# Altium project 24V-70A-Power-Board-v2.0.PrjPcb (part 6 of 8)
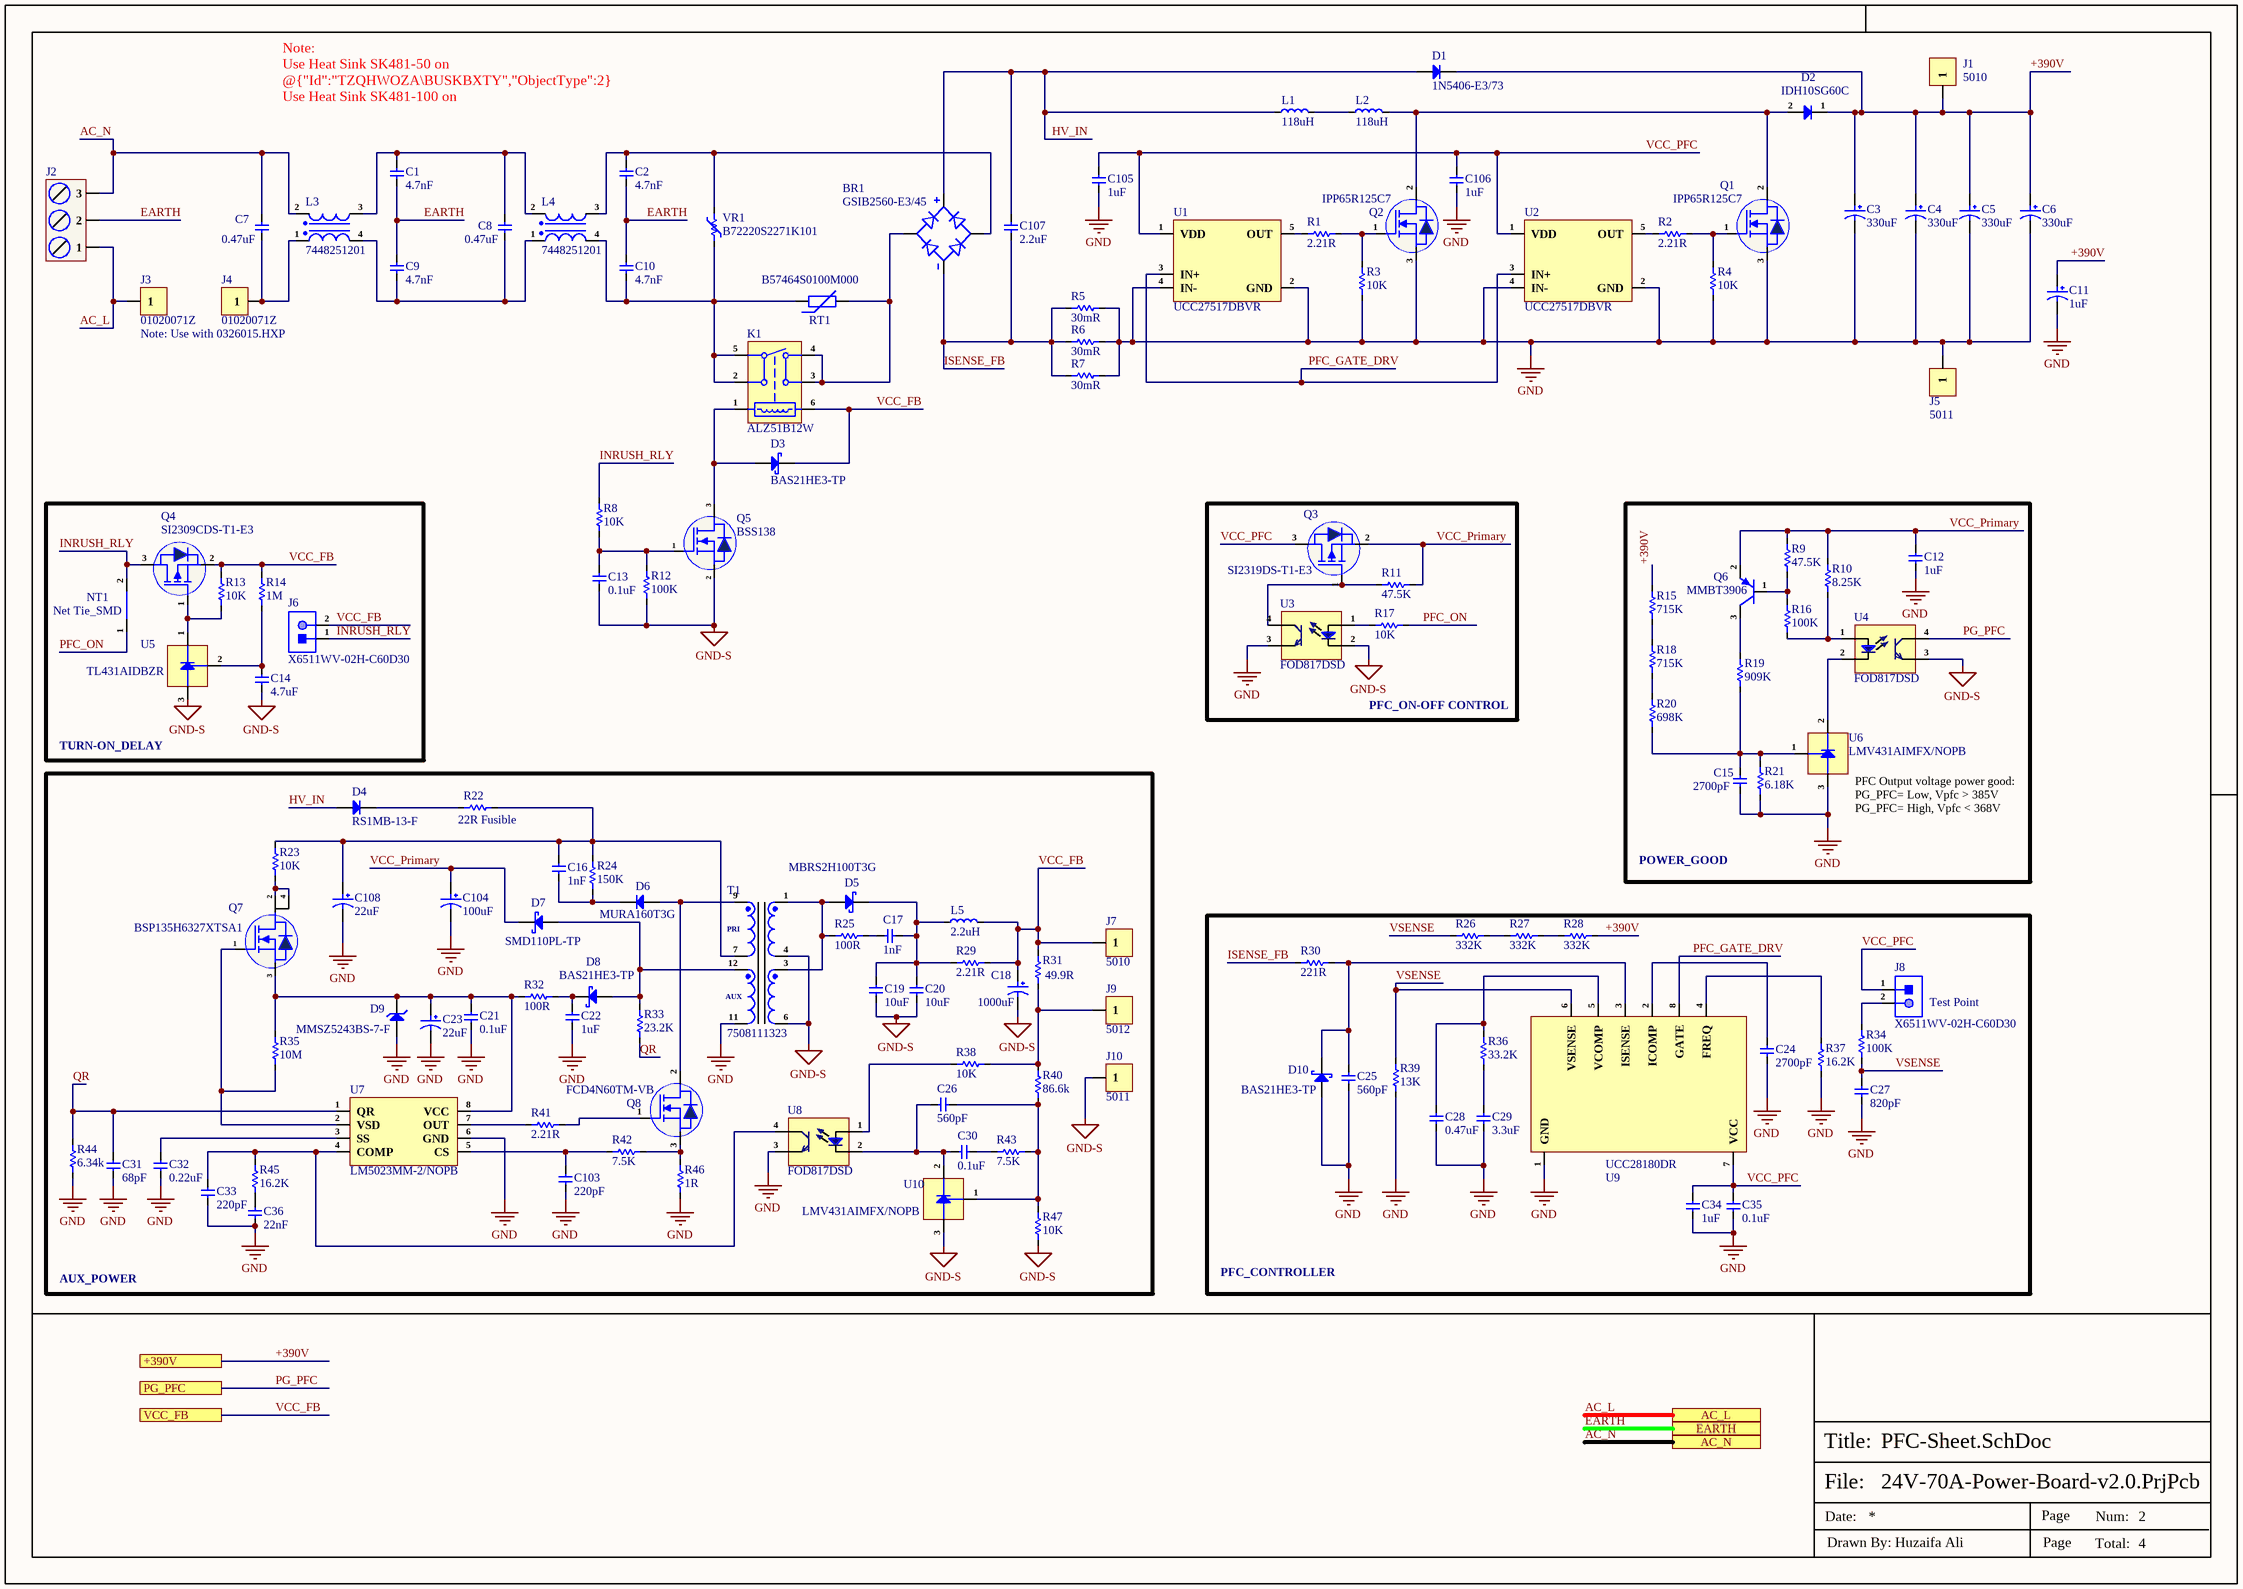
[diagram p8: PFC-Sheet.SchDoc]

## Sheet PFC-Sheet.SchDoc (continued)

### Library data of the parts (continued)
R37 R45 = CRCW060316K2FKEA: RES SMD 16.2K OHM 1% 1/10W 0603; Manufacturer: Vishay; Item Type: Resistors; Voltage Rating (DC): 75V; Supplier: Mouser; LCSC Part Number: C844531; Manufacturer Part Number: CRCW060316K2FKEA; RoHS: Yes; Stock: 14717; Pricing: 1=0.1, 10=0.016, 50=0.016, 100=0.01, 1000=0.008, 5000=0.005, 10000=0.004, 50000=0.003 (USD); Lead Free: 5697LeadFree; ComponentLink1URL: https://datasheet.ciiva.com/11810/0900766b80d98afc-11810432.pdf?src-supplier=Rs; ComponentLink1Description: https://datasheet.ciiva.com/11810/0900766b80d98afc-11810432.pdf?src-supplier=Rs; ComponentLink2URL: https://datasheet.ciiva.com/2513/dcrcwe3-2513620.pdf?src-supplier=Digikey; ComponentLink2Description: https://datasheet.ciiva.com/2513/dcrcwe3-2513620.pdf?src-supplier=Digikey; ComponentLink3URL: https://datasheet.ciiva.com/2513/dcrcwe3-2513621.pdf?src-supplier=Digikey; ComponentLink3Description: https://datasheet.ciiva.com/2513/dcrcwe3-2513621.pdf?src-supplier=Digikey; ComponentLink4URL: https://datasheet.ciiva.com/2513/dcrcwe3-2513622.pdf?src-supplier=Digikey; ComponentLink4Description: https://datasheet.ciiva.com/2513/dcrcwe3-2513622.pdf?src-supplier=Digikey; ComponentLink5URL: https://datasheet.ciiva.com/3257/dcrcwe3-3257083.pdf?src-supplier=Avnet; ComponentLink5Description: https://datasheet.ciiva.com/3257/dcrcwe3-3257083.pdf?src-supplier=Avnet; ComponentLink6URL: https://datasheet.ciiva.com/16204/dcrcwe3-16204298.pdf?src-supplier=Future+Electronics; ComponentLink6Description: https://datasheet.ciiva.com/16204/dcrcwe3-16204298.pdf?src-supplier=Future+Electronics; ComponentLink7URL: https://datasheet.ciiva.com/7663/1697337-7663893.pdf?src-supplier=Element14; ComponentLink7Description: https://datasheet.ciiva.com/7663/1697337-7663893.pdf?src-supplier=Element14; ComponentLink8URL: https://datasheet.ciiva.com/7173/1635184-7173002.pdf?src-supplier=Newark; ComponentLink8Description: https://datasheet.ciiva.com/7173/1635184-7173002.pdf?src-supplier=Newark; ComponentLink9URL: https://datasheet.ciiva.com/22702/1697337-22702885.pdf?src-supplier=Element14; ComponentLink9Description: https://datasheet.ciiva.com/22702/1697337-22702885.pdf?src-supplier=Element14; ComponentLink10URL: https://datasheet.ciiva.com/16787/70201119-16787821.pdf?src-supplier=Allied+Electronics; ComponentLink10Description: https://datasheet.ciiva.com/16787/70201119-16787821.pdf?src-supplier=Allied+Electronics; ComponentLink11URL: https://datasheet.ciiva.com/22869/70201119-22869438.pdf?src-supplier=Allied+Electronics; ComponentLink11Description: https://datasheet.ciiva.com/22869/70201119-22869438.pdf?src-supplier=Allied+Electronics; ComponentLink12URL: https://datasheet.ciiva.com/5548/dcrcwe3-109170-5548517.pdf?src-supplier=Mouser; ComponentLink12Description: https://datasheet.ciiva.com/5548/dcrcwe3-109170-5548517.pdf?src-supplier=Mouser; ComponentLink13URL: https://datasheet.ciiva.com/7792/125364-7792056.pdf?src-supplier=Element14; ComponentLink13Description: https://datasheet.ciiva.com/7792/125364-7792056.pdf?src-supplier=Element14
R39 = 0603WAF1302T5E: 100mW Thick Film Resistors ±100ppm/℃ ±1% 13kΩ 0603 Chip Resistor - Surface Mount ROHS; Manufacturer: UNI-ROYAL; Manufacturer Part Number: 0603WAF1302T5E; Package: 0603; LCSC Part Number: C22797; Item Type: Resistor; ComponentLink1Description: LCSC; ComponentLink1URL: https://www.lcsc.com/product-detail/Chip-Resistor-Surface-Mount_UNI-ROYAL-Uniroyal-Elec-0603WAF1302T5E_C22797.html
R40 = CRCW060386K6FKEA: RES SMD 86.6K OHM 1% 1/10W 0603; Manufacturer: Vishay; Item Type: Resistors; Value: 86.6kR; Power Rating: 100mW; Voltage Rating: 75V; Temperature Coefficient: 100ppm/°C; Supplier: Mouser; LCSC Part Number: C2076678; Manufacturer Part Number: CRCW060386K6FKEA; RoHS: Yes; Stock: 21228; Pricing: 1=0.1, 10=0.017, 50=0.017, 100=0.01, 1000=0.008, 10000=0.004 (USD); Case/Package: 0603; Pins: 2; Weight: 7.1E-05oz; Case Code (Metric): 1608; Case Code (Imperial): 0603; Contact Plating: Tin; Min Operating Temperature: -55°C; Max Operating Temperature: 155°C; Tolerance: 1%; Packaging: Tape and Reel; Package Quantity: 5000; Number of Terminations: 2; Termination: SMD/SMT; Max Power Dissipation: 100mW; Features: Automotive AEC-Q200; Series: CRCW; Resistor Type: Thick Film; Construction: Rectangular; Technology: THICK FILM; Resistance Tolerance: 1%; Voltage Rating (DC): 75V; Length: 1.55mm; Width: 0.85mm; Height: 0.45mm; Depth: 0.85mm; Ratings: AEC-Q200; Radiation Hardening: No; RoHS Compliant: Yes; Lead Free: 5697LeadFree; Military Standard: Not; Reach SVHC Compliant: Unknown; ComponentLink1URL: https://datasheet.ciiva.com/11812/0900766b80d98afc-11812181.pdf?src-supplier=Rs; ComponentLink1Description: https://datasheet.ciiva.com/11812/0900766b80d98afc-11812181.pdf?src-supplier=Rs; ComponentLink2URL: https://datasheet.ciiva.com/2466/dcrcwe3-2466293.pdf?src-supplier=Digikey; ComponentLink2Description: https://datasheet.ciiva.com/2466/dcrcwe3-2466293.pdf?src-supplier=Digikey; ComponentLink3URL: https://datasheet.ciiva.com/16779/70201119-16779662.pdf?src-supplier=Allied+Electronics; ComponentLink3Description: https://datasheet.ciiva.com/16779/70201119-16779662.pdf?src-supplier=Allied+Electronics; ComponentLink4URL: https://datasheet.ciiva.com/22869/70201119-22869020.pdf?src-supplier=Allied+Electronics; ComponentLink4Description: https://datasheet.ciiva.com/22869/70201119-22869020.pdf?src-supplier=Allied+Electronics; ComponentLink5URL: https://datasheet.ciiva.com/5549/dcrcwe3-109170-5549565.pdf?src-supplier=Mouser; ComponentLink5Description: https://datasheet.ciiva.com/5549/dcrcwe3-109170-5549565.pdf?src-supplier=Mouser; ComponentLink6URL: https://datasheet.ciiva.com/2466/dcrcwe3-2466294.pdf?src-supplier=Digikey; ComponentLink6Description: https://datasheet.ciiva.com/2466/dcrcwe3-2466294.pdf?src-supplier=Digikey; ComponentLink7URL: https://datasheet.ciiva.com/2466/dcrcwe3-2466295.pdf?src-supplier=Digikey; ComponentLink7Description: https://datasheet.ciiva.com/2466/dcrcwe3-2466295.pdf?src-supplier=Digikey; ComponentLink8URL: https://datasheet.ciiva.com/3257/dcrcwe3-3257941.pdf?src-supplier=Avnet; ComponentLink8Description: https://datasheet.ciiva.com/3257/dcrcwe3-3257941.pdf?src-supplier=Avnet; ComponentLink9URL: https://datasheet.ciiva.com/8337/dcrcwe3-8337688.pdf?src-supplier=Avnet; ComponentLink9Description: https://datasheet.ciiva.com/8337/dcrcwe3-8337688.pdf?src-supplier=Avnet; ComponentLink10URL: https://datasheet.ciiva.com/16435/dcrcw-16435963.pdf?src-supplier=Future+Electronics; ComponentLink10Description: https://datasheet.ciiva.com/16435/dcrcw-16435963.pdf?src-supplier=Future+Electronics
R42 = CRCW06037K50FKEA: RES SMD 7.5K OHM 1% 1/10W 0603; Manufacturer: Vishay; Item Type: Resistor; Value: 7.5kR; Temperature Coefficient: 100ppm/°C; Max Power Dissipation: 100mW; Voltage Rating: 75V; Supplier: Mouser; LCSC Part Number: C844808; Manufacturer Part Number: CRCW06037K50FKEA; RoHS: Yes; Stock: 12180; Pricing: 1=0.1, 10=0.017, 50=0.017, 100=0.01, 1000=0.008, 10000=0.004 (USD); Case/Package: 0603; Case Code (Metric): 1608; Case Code (Imperial): 0603; Contact Plating: Tin; Weight: 7.1E-05oz; Min Operating Temperature: -55°C; Max Operating Temperature: 155°C; Tolerance: 1%; Packaging: Tape and Reel; Package Quantity: 5000; Number of Terminations: 2; Features: Automotive AEC-Q200; Series: CRCW; Resistor Type: Thick Film; Power Rating: 100mW; Termination: SMD/SMT; Technology: THICK FILM; Construction: Rectangular; Resistance Tolerance: 1%; Voltage Rating (DC): 75V; Length: 1.55mm; Width: 0.85mm; Height: 0.45mm; Depth: 0.85mm; Ratings: AEC-Q200; Radiation Hardening: No; Lead Free: 5697LeadFree; RoHS Compliant: Yes; Military Standard: Not; Reach SVHC Compliant: Unknown; ComponentLink1URL: https://datasheet.ciiva.com/11810/0900766b80d98afc-11810928.pdf?src-supplier=Rs; ComponentLink1Description: https://datasheet.ciiva.com/11810/0900766b80d98afc-11810928.pdf?src-supplier=Rs; ComponentLink2URL: https://datasheet.ciiva.com/26314/fld-crcw-e3-data-en-26314746.pdf?src-supplier=Distrelec; ComponentLink2Description: https://datasheet.ciiva.com/26314/fld-crcw-e3-data-en-26314746.pdf?src-supplier=Distrelec; ComponentLink3URL: https://datasheet.ciiva.com/7679/1697337-7679146.pdf?src-supplier=Element14; ComponentLink3Description: https://datasheet.ciiva.com/7679/1697337-7679146.pdf?src-supplier=Element14; ComponentLink4URL: https://datasheet.ciiva.com/2465/dcrcwe3-2465715.pdf?src-supplier=Digikey; ComponentLink4Description: https://datasheet.ciiva.com/2465/dcrcwe3-2465715.pdf?src-supplier=Digikey; ComponentLink5URL: https://datasheet.ciiva.com/2465/dcrcwe3-2465716.pdf?src-supplier=Digikey; ComponentLink5Description: https://datasheet.ciiva.com/2465/dcrcwe3-2465716.pdf?src-supplier=Digikey; ComponentLink6URL: https://datasheet.ciiva.com/2465/dcrcwe3-2465714.pdf?src-supplier=Digikey; ComponentLink6Description: https://datasheet.ciiva.com/2465/dcrcwe3-2465714.pdf?src-supplier=Digikey; ComponentLink7URL: https://datasheet.ciiva.com/16774/70201119-16774541.pdf?src-supplier=Allied+Electronics; ComponentLink7Description: https://datasheet.ciiva.com/16774/70201119-16774541.pdf?src-supplier=Allied+Electronics; ComponentLink8URL: https://datasheet.ciiva.com/5544/dcrcwe3-109170-5544283.pdf?src-supplier=Mouser; ComponentLink8Description: https://datasheet.ciiva.com/5544/dcrcwe3-109170-5544283.pdf?src-supplier=Mouser; ComponentLink9URL: https://datasheet.ciiva.com/3257/dcrcwe3-3257903.pdf?src-supplier=Avnet; ComponentLink9Description: https://datasheet.ciiva.com/3257/dcrcwe3-3257903.pdf?src-supplier=Avnet; ComponentLink10URL: https://datasheet.ciiva.com/16389/dcrcw-16389894.pdf?src-supplier=Future+Electronics; ComponentLink10Description: https://datasheet.ciiva.com/16389/dcrcw-16389894.pdf?src-supplier=Future+Electronics; ComponentLink11URL: https://datasheet.ciiva.com/3257/dcrcwe3-3257902.pdf?src-supplier=Avnet; ComponentLink11Description: https://datasheet.ciiva.com/3257/dcrcwe3-3257902.pdf?src-supplier=Avnet
R43 = RT0603BRD077K5L: RES SMD 7.5K OHM 0.1% 1/10W 0603; Manufacturer: Yageo; Resistance: 7.5kR; Power Rating: 100mW; Voltage Rating: 75V; Temperature Coefficient: 25ppm/°C; Voltage Rating (DC): 50V; Item Type: Resistor; Supplier 1: Avnet; Manufacturer Part Number: RT0603BRD077K5L; RoHS: Yes; Category: Chip SMD Resistors; Stock 1: 30000; Pricing 1: 5000=0.02327, 10000=0.02294, 20000=0.02227 (USD); Case/Package: 0603; Case Code (Imperial): 0603; Case Code (Metric): 1608; Weight: 7.1E-05oz; Contact Plating: Tin,Matte; Size Code: 0603; Min Operating Temperature: -55°C; Max Operating Temperature: 125°C; Package Quantity: 5000; Packaging: Tape and Reel; Tolerance: 0.1%; Resistor Type: Thin Film; Termination: SMD/SMT; Number of Terminations: 2; Max Power Dissipation: 100mW; Features: Moisture Resistant; Series: RT; Length: 0.063inch; Width: 0.8mm; Height: 0.022inch; Radiation Hardening: No; Lead Free: Lead Free; RoHS Compliant: Yes; ComponentLink1URL: https://datasheet.ciiva.com/8891/pyu-rt-1-to-0-05-rohs-l-4-8891914.pdf?src-supplier=Avnet; ComponentLink1Description: https://datasheet.ciiva.com/8891/pyu-rt-1-to-0-05-rohs-l-4-8891914.pdf?src-supplier=Avnet; Supplier Part Number 1: RT0603BRD077K5L; LCSC Part Number: C728597
R44 = RT0603BRD076K34L: RES SMD 6.34KOHM 0.1% 1/10W 0603; Manufacturer: Yageo; Resistance: 6.34kR; Power Rating: 100mW; Voltage Rating: 75V; Temperature Coefficient: 25ppm/°C; Voltage Rating (DC): 50V; Item Type: Resistor; Supplier 1: Digi-Key; Manufacturer Part Number: RT0603BRD076K34L; RoHS: Yes; Category: Chip SMD Resistors; Stock 1: 15385; Pricing 1: 1=0.34000, 10=0.28800, 100=0.11260, 500=0.06812, 1000=0.04716, 2500=0.04322 (USD); Case/Package: 0603; Case Code (Imperial): 0603; Case Code (Metric): 1608; Weight: 7.1E-05oz; Min Operating Temperature: -55°C; Max Operating Temperature: 125°C; Packaging: Tape and Reel; Tolerance: 0.1%; Termination: SMD/SMT; Series: RT; Length: 1.6mm; Width: 0.8mm; Height: 0.45mm; Lead Free: Lead Free; RoHS Compliant: Yes; ComponentLink1URL: https://datasheet.ciiva.com/12811/pyu-rt-1-to-0-05-rohs-l-4-12811741.pdf?src-supplier=Mouser; ComponentLink1Description: https://datasheet.ciiva.com/12811/pyu-rt-1-to-0-05-rohs-l-4-12811741.pdf?src-supplier=Mouser; LCSC Part Number: C861532; Supplier Part Number 1: YAG4590CT-ND
R46 = CRCW12061R00FKEA: RES SMD 1 OHM 1% 1/4W 1206; Manufacturer: Vishay; Item Type: Resistor; Voltage Rating (DC): 200V; Supplier: Mouser; LCSC Part Number: C844870; Manufacturer Part Number: CRCW12061R00FKEA; RoHS: Yes; Stock: 28572; Pricing: 1=0.12, 10=0.037, 50=0.037, 100=0.024, 1000=0.021, 10000=0.013 (USD); Lead Free: 5697LeadFree; ComponentLink1URL: https://datasheet.ciiva.com/11811/0900766b80d98b5e-11811443.pdf?src-supplier=Rs; ComponentLink1Description: https://datasheet.ciiva.com/11811/0900766b80d98b5e-11811443.pdf?src-supplier=Rs; ComponentLink2URL: https://datasheet.ciiva.com/5548/dcrcwe3-109170-5548686.pdf?src-supplier=Mouser; ComponentLink2Description: https://datasheet.ciiva.com/5548/dcrcwe3-109170-5548686.pdf?src-supplier=Mouser; ComponentLink3URL: https://datasheet.ciiva.com/16724/70201119-16724205.pdf?src-supplier=Allied+Electronics; ComponentLink3Description: https://datasheet.ciiva.com/16724/70201119-16724205.pdf?src-supplier=Allied+Electronics; ComponentLink4URL: https://datasheet.ciiva.com/7841/1720486-7841869.pdf?src-supplier=Element14; ComponentLink4Description: https://datasheet.ciiva.com/7841/1720486-7841869.pdf?src-supplier=Element14; ComponentLink5URL: https://datasheet.ciiva.com/16295/dcrcwe3-16295679.pdf?src-supplier=Future+Electronics; ComponentLink5Description: https://datasheet.ciiva.com/16295/dcrcwe3-16295679.pdf?src-supplier=Future+Electronics; ComponentLink6URL: https://datasheet.ciiva.com/2468/dcrcwe3-2468799.pdf?src-supplier=Digikey; ComponentLink6Description: https://datasheet.ciiva.com/2468/dcrcwe3-2468799.pdf?src-supplier=Digikey; ComponentLink7URL: https://datasheet.ciiva.com/2468/dcrcwe3-2468800.pdf?src-supplier=Digikey; ComponentLink7Description: https://datasheet.ciiva.com/2468/dcrcwe3-2468800.pdf?src-supplier=Digikey; ComponentLink8URL: https://datasheet.ciiva.com/2468/dcrcwe3-2468801.pdf?src-supplier=Digikey; ComponentLink8Description: https://datasheet.ciiva.com/2468/dcrcwe3-2468801.pdf?src-supplier=Digikey; ComponentLink9URL: https://datasheet.ciiva.com/9109/dcrcwe3-9109199.pdf?src-supplier=Avnet; ComponentLink9Description: https://datasheet.ciiva.com/9109/dcrcwe3-9109199.pdf?src-supplier=Avnet
RT1 = B57464S0100M000: ICL 10 OHM 20% 8A 26MM; Manufacturer: TDK EPCOS; Item Type: THermistor; Supplier: Digikey; Supplier Part Number: 495-4111-ND; Manufacturer Part Number: B57464S0100M000; RoHS: Yes; Pricing: 1=5.3, 5=4.42, 10=4.087, 50=3.4022, 200=2.9015, 400=2.6778, 600=2.5544, 1000=2.50812 (USD); ComponentLink1URL: https://datasheet.ciiva.com/46435/1795241-46435759.pdf?src-supplier=Element14; ComponentLink1Description: https://datasheet.ciiva.com/46435/1795241-46435759.pdf?src-supplier=Element14; ComponentLink2URL: https://datasheet.ciiva.com/7982/1795241-7982525.pdf?src-supplier=Element14; ComponentLink2Description: https://datasheet.ciiva.com/7982/1795241-7982525.pdf?src-supplier=Element14
T1 = 7508111323: XFMR FLYBACK AC/DC CONV 2MH TH; Manufacturer: Wurth Electronics; Item Type: Transformer; Supplier: Digikey; Supplier Part Number: 732-7508111323CT-ND; Manufacturer Part Number: 7508111323; RoHS: No; Stock: 130; Pricing: 1=6.34, 25=6.3092, 50=5.735 (USD)
U1 U2 = UCC27517DBVR: IC GATE DRVR LOW-SIDE SOT23-5; Manufacturer: Texas Instruments; Operating Supply Voltage: 12V; Number of Outputs: 1; Max Supply Voltage: 18V; Min Supply Voltage: 4.5V; Rise Time: 22ns; Propagation Delay: 30ns; Output Current: 4A; Channel Type: Single; Fall Time: 11ns; Supplier: Mouser; LCSC Part Number: C99395; Manufacturer Part Number: UCC27517DBVR; RoHS: Yes; Item Type: IC; Stock: 71094; Pricing: 1=0.77, 10=0.646, 50=0.646, 100=0.501, 1000=0.346, 10000=0.29 (USD); Mounting Technology: Surface Mount; Case/Package: SOT-23-5; Pins: 5; Min Operating Temperature: -40°C; Max Operating Temperature: 140°C; Packaging: Tape and Reel; Package Quantity: 3000; Max Output current: 4A; Number of Drivers: 1; Turn-On Delay Time: 30ns; Number of Channels: 1; Series: -; Length: 2.9mm; Width: 1.6mm; Height: 1.45mm; Thickness: 1.2mm; Radiation Hardening: No; Lead Free: Lead Free; RoHS Compliant: Yes; ComponentLink1URL: http://components.arrow.com/part/dataview/52526194S5756N7713?src-supplier=Arrow+Electronics; ComponentLink1Description: http://components.arrow.com/part/dataview/52526194S5756N7713?src-supplier=Arrow+Electronics; ComponentLink2URL: http://www.ti.com/lit/ds/symlink/ucc27517.pdf?src-supplier=Avnet; ComponentLink2Description: http://www.ti.com/lit/ds/symlink/ucc27517.pdf?src-supplier=Avnet; ComponentLink3URL: http://www.ti.com/lit/ds/symlink/ucc27517.pdf?src-supplier=Digikey; ComponentLink3Description: http://www.ti.com/lit/ds/symlink/ucc27517.pdf?src-supplier=Digikey; ComponentLink4URL: http://www.ti.com/lit/gpn/ucc27517?src-supplier=Mouser; ComponentLink4Description: http://www.ti.com/lit/gpn/ucc27517?src-supplier=Mouser; ComponentLink5URL: http://www.ti.com/general/docs/lit/getliterature.tsp?genericPartNumber=UCC27516&&fileType=pdf&src-supplier=Avnet; ComponentLink5Description: http://www.ti.com/general/docs/lit/getliterature.tsp?genericPartNumber=UCC27516&&fileType=pdf&src-supplier=Avnet; ComponentLink6URL: https://www.verical.com/server-webapp/html/getDatasheet?partID=482756&src-supplier=Verical; ComponentLink6Description: https://www.verical.com/server-webapp/html/getDatasheet?partID=482756&src-supplier=Verical
U3 U4 U8 = FOD817DSD: OPTOISOLATOR 5KV TRANSISTOR 4SMD; Manufacturer: ON Semiconductor / Fairchild; Item Type: Optocouplers; Supplier: Future Electronics; LCSC Part Number: C241832; Manufacturer Part Number: FOD817DSD; RoHS: Yes; Stock: 194000; Pricing: 1000=0.153, 3000=0.148, 5000=0.146, 15000=0.142, 25000=0.138 (USD); ComponentLink1URL: https://datasheet.ciiva.com/2085/fod817-2085872.pdf?src-supplier=Digikey; ComponentLink1Description: https://datasheet.ciiva.com/2085/fod817-2085872.pdf?src-supplier=Digikey; ComponentLink2URL: https://datasheet.ciiva.com/30520/2018343-30520890.pdf?src-supplier=Jameco; ComponentLink2Description: https://datasheet.ciiva.com/30520/2018343-30520890.pdf?src-supplier=Jameco; ComponentLink3URL: https://datasheet.ciiva.com/15118/getdatasheetpartid-110546-15118613.pdf?src-supplier=Verical; ComponentLink3Description: https://datasheet.ciiva.com/15118/getdatasheetpartid-110546-15118613.pdf?src-supplier=Verical; ComponentLink4URL: https://datasheet.ciiva.com/2085/fod817d-2085873.pdf?src-supplier=Digikey; ComponentLink4Description: https://datasheet.ciiva.com/2085/fod817d-2085873.pdf?src-supplier=Digikey; ComponentLink5URL: https://datasheet.ciiva.com/2085/fod817d-2085874.pdf?src-supplier=Digikey; ComponentLink5Description: https://datasheet.ciiva.com/2085/fod817d-2085874.pdf?src-supplier=Digikey; ComponentLink6URL: https://datasheet.ciiva.com/8095/fod817d-8095134.pdf?src-supplier=Avnet; ComponentLink6Description: https://datasheet.ciiva.com/8095/fod817d-8095134.pdf?src-supplier=Avnet; ComponentLink7URL: https://datasheet.ciiva.com/17277/fod817-17277350.pdf?src-supplier=Future+Electronics; ComponentLink7Description: https://datasheet.ciiva.com/17277/fod817-17277350.pdf?src-supplier=Future+Electronics
U5 = TL431AIDBZR: IC VREF SHUNT ADJ 1% SOT23-3; Manufacturer: Texas Instruments; Output Voltage: 36V; Number of Channels: 1; Cathode Current: 700uA; Output Current: 100mA; Reference Type: Shunt,Adjustable; Min Input Voltage: 2.495V; Max Supply Voltage: 37V; Temperature Coefficient: 92ppm/°C; Output Type: Adjustable; Supplier: Mouser; LCSC Part Number: C23892; Manufacturer Part Number: TL431AIDBZR; RoHS: Yes; Item Type: IC; Stock: 732677; Pricing: 1=0.25, 10=0.142, 50=0.142, 100=0.099, 1000=0.095, 10000=0.08 (USD); Case/Package: SOT-23; Pins: 3; Min Operating Temperature: -40°C; Max Operating Temperature: 125°C; Packaging: Tape and Reel; Package Quantity: 1; Tolerance: 1%; Reference Voltage: 36V; Series: -; Max Output current: 100mA; Min Output Voltage: 2.495V; Max Output Voltage: 36V; Radiation Hardening: No; Lead Free: Lead Free; RoHS Compliant: Yes; Reach SVHC Compliant: No; ComponentLink1URL: https://datasheet.ciiva.com/3235/tl432b-3235600.pdf?src-supplier=Avnet; ComponentLink1Description: https://datasheet.ciiva.com/3235/tl432b-3235600.pdf?src-supplier=Avnet; ComponentLink2URL: https://datasheet.ciiva.com/15148/getdatasheetpartid-171576-15148968.pdf?src-supplier=Verical; ComponentLink2Description: https://datasheet.ciiva.com/15148/getdatasheetpartid-171576-15148968.pdf?src-supplier=Verical; ComponentLink3URL: https://datasheet.ciiva.com/41462/001014548-da-01-en-ic-vref-shunt-prec-tl431aidbzr-sot-3-tid-41462400.pdf?src-supplier=Conrad; ComponentLink3Description: https://datasheet.ciiva.com/41462/001014548-da-01-en-ic-vref-shunt-prec-tl431aidbzr-sot-3-tid-41462400.pdf?src-supplier=Conrad; ComponentLink4URL: https://datasheet.ciiva.com/46397/1887475-46397705.pdf?src-supplier=Element14; ComponentLink4Description: https://datasheet.ciiva.com/46397/1887475-46397705.pdf?src-supplier=Element14; ComponentLink5URL: https://datasheet.ciiva.com/2006/tl431a-2006188.pdf?src-supplier=Digikey; ComponentLink5Description: https://datasheet.ciiva.com/2006/tl431a-2006188.pdf?src-supplier=Digikey; ComponentLink6URL: https://datasheet.ciiva.com/2006/tl431a-2006187.pdf?src-supplier=Digikey; ComponentLink6Description: https://datasheet.ciiva.com/2006/tl431a-2006187.pdf?src-supplier=Digikey; ComponentLink7URL: https://datasheet.ciiva.com/2006/tl431a-2006189.pdf?src-supplier=Digikey; ComponentLink7Description: https://datasheet.ciiva.com/2006/tl431a-2006189.pdf?src-supplier=Digikey
U6 U10 = LMV431AIMFX/NOPB: IC VREF SHUNT ADJ 1% SOT23-3; Manufacturer: TI National Semiconductor; Supplier: Mouser; LCSC Part Number: C478069; Manufacturer Part Number: LMV431AIMFX/NOPB; RoHS: Yes; Item Type: IC; Stock: 22360; Pricing: 1=0.68, 10=0.561, 50=0.561, 100=0.425, 1000=0.29, 10000=0.24 (USD); ComponentLink1URL: https://datasheet.ciiva.com/2012/lmv431-2012949.pdf?src-supplier=Digikey; ComponentLink1Description: https://datasheet.ciiva.com/2012/lmv431-2012949.pdf?src-supplier=Digikey; ComponentLink2URL: https://datasheet.ciiva.com/2012/lmv431-2012950.pdf?src-supplier=Digikey; ComponentLink2Description: https://datasheet.ciiva.com/2012/lmv431-2012950.pdf?src-supplier=Digikey; ComponentLink3URL: https://datasheet.ciiva.com/6596/lmv431-6596021.pdf?src-supplier=Digikey; ComponentLink3Description: https://datasheet.ciiva.com/6596/lmv431-6596021.pdf?src-supplier=Digikey; ComponentLink4URL: https://datasheet.ciiva.com/46424/1841927-46424699.pdf?src-supplier=Element14; ComponentLink4Description: https://datasheet.ciiva.com/46424/1841927-46424699.pdf?src-supplier=Element14
U7 = LM5023MM-2/NOPB: IC OFFLINE SWITCH FLYBACK 8VSSOP; Manufacturer: Texas Instruments; Min Supply Voltage: 8V; Max Supply Voltage: 14V; Frequency: 130kHz; Rise Time: 25ns; Number of Outputs: 1; Max Duty Cycle: 50%; Fall Time: 15ns; Operating Supply Current: 800uA; Duty Cycle: 0%; Fault Protection: Over Voltage; Supplier: Mouser; LCSC Part Number: C2871051; Manufacturer Part Number: LM5023MM-2/NOPB; RoHS: Yes; Item Type: IC; Stock: 1589; Pricing: 1=1.17, 10=0.891, 50=0.891, 100=0.811, 1000=0.643, 10000=0.627 (USD); Mounting Technology: Surface Mount; Case/Package: VSSOP; Pins: 8; Min Operating Temperature: -40°C; Max Operating Temperature: 125°C; Packaging: Cut Tape; Switching Frequency: 130kHz; Package Quantity: 1000; Topology: Flyback; Series: -; Nominal Supply Current: 800uA; Length: 3mm; Width: 3mm; Height: 1.07mm; Thickness: 970um; Radiation Hardening: No; Reach SVHC Compliant: No; Lead Free: Lead Free; RoHS Compliant: Yes; ComponentLink1URL: https://datasheet.ciiva.com/23940/1752268-23940537.pdf?src-supplier=Newark; ComponentLink1Description: https://datasheet.ciiva.com/23940/1752268-23940537.pdf?src-supplier=Newark; ComponentLink2URL: https://datasheet.ciiva.com/30018/lm5023-30018293.pdf?src-supplier=Avnet; ComponentLink2Description: https://datasheet.ciiva.com/30018/lm5023-30018293.pdf?src-supplier=Avnet; ComponentLink3URL: https://datasheet.ciiva.com/22748/1804927-22748090.pdf?src-supplier=Element14; ComponentLink3Description: https://datasheet.ciiva.com/22748/1804927-22748090.pdf?src-supplier=Element14; ComponentLink4URL: https://datasheet.ciiva.com/29610/lm5023-29610235.pdf?src-supplier=Digikey; ComponentLink4Description: https://datasheet.ciiva.com/29610/lm5023-29610235.pdf?src-supplier=Digikey; ComponentLink5URL: https://datasheet.ciiva.com/29610/lm5023-29610236.pdf?src-supplier=Digikey; ComponentLink5Description: https://datasheet.ciiva.com/29610/lm5023-29610236.pdf?src-supplier=Digikey; ComponentLink6URL: https://datasheet.ciiva.com/18617/lm5023-18617703.pdf?src-supplier=Digikey; ComponentLink6Description: https://datasheet.ciiva.com/18617/lm5023-18617703.pdf?src-supplier=Digikey; ComponentLink7URL: https://datasheet.ciiva.com/30018/lm5023-30018294.pdf?src-supplier=Avnet; ComponentLink7Description: https://datasheet.ciiva.com/30018/lm5023-30018294.pdf?src-supplier=Avnet
U9 = UCC28180DR: IC PFC CTRLR CCM 250KHZ 8SOIC; Manufacturer: Texas Instruments; Supplier: Mouser; LCSC Part Number: C88567; Manufacturer Part Number: UCC28180DR; RoHS: Yes; Item Type: IC; Stock: 6340; Pricing: 1=1.44, 10=1.29, 50=1.29, 100=1.01, 1000=0.66, 10000=0.563 (USD); ComponentLink1URL: https://datasheet.ciiva.com/24141/slusbq5a-317155-24141395.pdf?src-supplier=Mouser; ComponentLink1Description: https://datasheet.ciiva.com/24141/slusbq5a-317155-24141395.pdf?src-supplier=Mouser; ComponentLink2URL: https://datasheet.ciiva.com/29899/ucc28180-29899377.pdf?src-supplier=Avnet; ComponentLink2Description: https://datasheet.ciiva.com/29899/ucc28180-29899377.pdf?src-supplier=Avnet
VR1 = B72220S2271K101: VARISTOR 430V 10KA DISC 20MM; Manufacturer: TDK EPCOS; Item Type: Varistors; Value: 630pF; Max Output current: 8kA; Voltage Rating: 350V; Number of Circuits: 1; Max Voltage Rating (AC): 275V; Energy: 215J; Min Varistor Voltage: 387V; Max Varistor Voltage: 473V; Lead/Base Style: Radial; Clamping Current: 100A; Clamping Voltage: 710V; Voltage Tolerance: 10%; Power Rating: 1W; Supplier: Digikey; LCSC Part Number: C210767; Manufacturer Part Number: B72220S2271K101; RoHS: Yes; Stock: 13458; Pricing: 1=1.43, 10=0.901, 25=0.7632, 100=0.6065, 250=0.53008, 500=0.4833, 1000=0.44435, 2500=0.40274, 5000=0.37737 (USD); Mounting Technology: Through Hole; Case/Package: Metal; Material: 4240ConductorMaterial; Weight: 4.000004g; Min Operating Temperature: -40°C; Max Operating Temperature: 85°C; Packaging: Bulk; Max Voltage Rating (DC): 350V; Varistor Voltage: 430V; Max Surge Current: 10kA; Series: AdvanceD; Voltage Rating (AC): 275V; Voltage Rating (DC): 350V; Termination: 4745ConnectorType; Lead Pitch: 10mm; Depth: 5.8mm; Radiation Hardening: 5898YesNo; RoHS Compliant: Yes; Reach SVHC Compliant: Unknown; Flammability Rating: 5813Flammability; Lead Free: 5697LeadFree; ComponentLink1URL: https://datasheet.ciiva.com/28408/1680955-28408747.pdf?src-supplier=Element14; ComponentLink1Description: https://datasheet.ciiva.com/28408/1680955-28408747.pdf?src-supplier=Element14; ComponentLink2URL: https://datasheet.ciiva.com/16417/siov-leaded-advanced-16417989.pdf?src-supplier=Future+Electronics; ComponentLink2Description: https://datasheet.ciiva.com/16417/siov-leaded-advanced-16417989.pdf?src-supplier=Future+Electronics

## Sheet Control-Sheet.SchDoc
size 420 x 297 mm; SheetNumber: 4; SheetTotal: 4
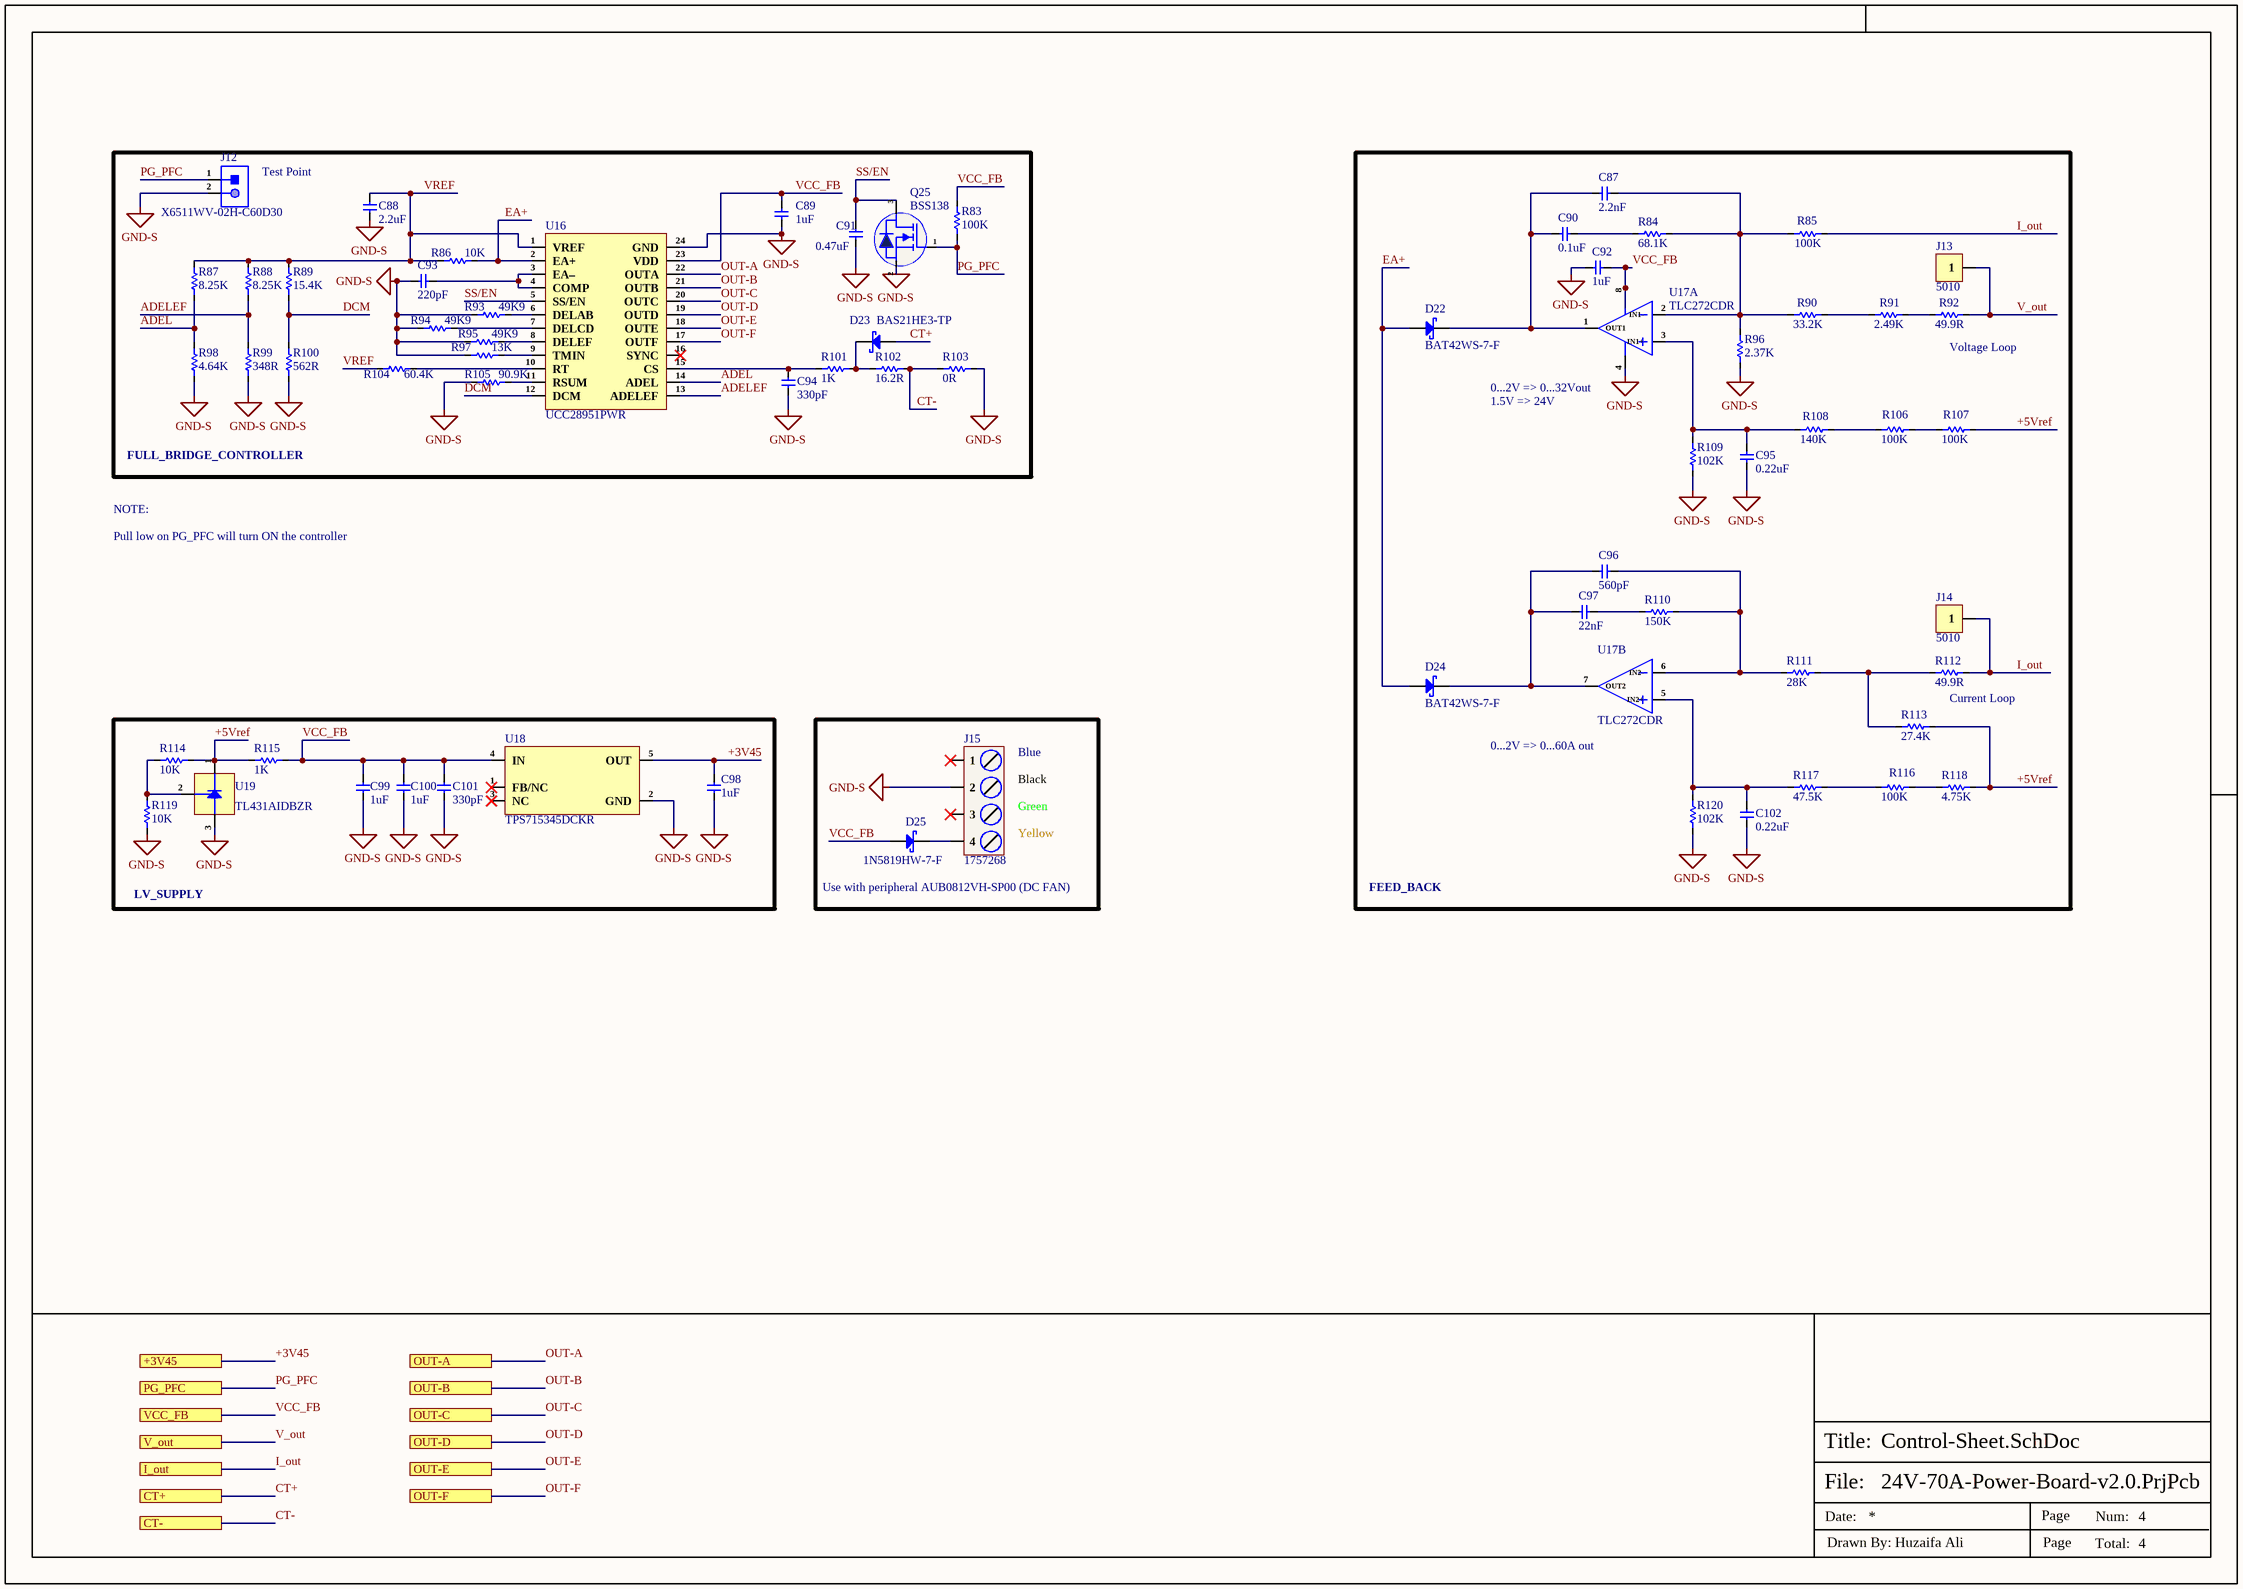
[diagram p3: Control-Sheet.SchDoc]

### Parts
C87  2.2nF  [Cap-0603]
C88  2.2uF  [Cap-0805]
C89  1uF  [Cap-0603]
C90  0.1uF  [Cap-0603]
C91  0.47uF  [Cap-0805]
C92  1uF  [Cap-0603]
C93  220pF  [Cap-0603]
C94  330pF  [Cap-0603]
C95  0.22uF  [Cap-0603]
C96  560pF  [Cap-0603]
C97  22nF  [Cap-0603]
C98  1uF  [Cap-0603]
C99  1uF  [Cap-0603]
C100  1uF  [Cap-0603]
C101  330pF  [Cap-0603]
C102  0.22uF  [Cap-0603]
D22  BAT42WS-7-F  [SOD-323]
D23  BAS21HE3-TP  [SOT-23]
D24  BAT42WS-7-F  [SOD-323]
D25  1N5819HW-7-F  [SOD-123]
J12  X6511WV-02H-C60D30  [HDR1X2_]
J13  5010  [5010]
J14  5010  [5010]
J15  1757268  [1757268]
Q25  BSS138  [Sot-23]
R83  100K  [Res-0603]
R84  68.1K  [Res-0603]
R85  100K  [Res-0603]
R86  10K  [Res-0603]
R87  8.25K  [Res-0603]
R88  8.25K  [Res-0603]
R89  15.4K  [Res-0603]
R90  33.2K  [Res-0603]
R91  2.49K  [Res-0603]
R92  49.9R  [Res-0603]
R93  49K9  [Res-0603]
R94  49K9  [Res-0603]
R95  49K9  [Res-0603]
R96  2.37K  [Res-0603]
R97  13K  [Res-0603]
R98  4.64K  [Res-0603]
R99  348R  [Res-0603]
R100  562R  [Res-0603]
R101  1K  [Res-0603]
R102  16.2R  [RES-2512]
R103  0R  [Res-1206]
R104  60.4K  [Res-0603]
R105  90.9K  [Res-0603]
R106  100K  [Res-0603]
R107  100K  [Res-0603]
R108  140K  [Res-0603]
R109  102K  [Res-0603]
R110  150K  [Res-0603]
R111  28K  [Res-0603]
R112  49.9R  [Res-0603]
R113  27.4K  [Res-0603]
R114  10K  [Res-0603]
R115  1K  [Res-0603]
R116  100K  [Res-0603]
R117  47.5K  [Res-0603]
R118  4.75K  [Res-0603]
R119  10K  [Res-0603]
R120  102K  [Res-0603]
U16  UCC28951PWR  [TSSOP-24]
U17  TLC272CDR  [SOIC-8(0.154", 3.90mm Width)]  (parts A,B of 2)
U18  TPS715345DCKR  [SC70-5]
U19  TL431AIDBZR  [SOT-23]

### Blocks framed on the sheet
LV_SUPPLY: C98-C101 R114 R115 R119 U18 U19

### Ports
+3V45 (see Top-Sheet[3C], Power-Sheet[2D]), CT+ (see Top-Sheet[3B], Power-Sheet[1D]), CT- (see Top-Sheet[3B], Power-Sheet[1D]), I_out (see Top-Sheet[3C], Power-Sheet[1D]), OUT-A (see Top-Sheet[3B], Power-Sheet[2D]), OUT-B (see Top-Sheet[3B], Power-Sheet[2D]), OUT-C (see Top-Sheet[3B], Power-Sheet[2D]), OUT-D (see Top-Sheet[3B], Power-Sheet[2D]), OUT-E (see Top-Sheet[3B], Power-Sheet[2D]), OUT-F (see Top-Sheet[3B], Power-Sheet[2D]), PG_PFC (see Top-Sheet[3C], PFC-Sheet[1D], Power-Sheet[1D]), V_out (see Top-Sheet[3B], Power-Sheet[1D]), VCC_FB (see Top-Sheet[3C], PFC-Sheet[1D], Power-Sheet[1D])

### Nets
GND-S: C88.1 C89.1 C91.1 C92.1 C93.1 C94.1 C95.1 C98.1 C99.1 C100.1 C101.1 C102.1 J12.2 J15.2 Q25.2(S) R93.1 R94.1 R95.1 R96.1 R97.1 R98.1 R99.1 R100.1 R103.2 R105.1 R109.1 R119.2 R120.1 U16.24(GND) U17.4(VDD-/GND) U18.2(GND) U19.3(Anode)
+3V45: C98.2 U18.5(OUT) ; port +3V45
+5Vref: R107.2 R113.2 R114.2 R115.1 R118.2 U19.1(Cathode)
ADEL: R87.1 R98.2 U16.14(ADEL)
ADELEF: R88.1 R99.2 U16.13(ADELEF)
CT+: D23.1(A) ; port CT+
CT-: R102.2 R103.1 ; port CT-
DCM: R89.1 R100.2 U16.12(DCM)
EA+: D22.2(A) D24.2(A) R86.2 U16.2(EA+)
I_out: J14.1 R85.2 R112.2 ; port I_out
OUT-A: U16.22(OUTA) ; port OUT-A
OUT-B: U16.21(OUTB) ; port OUT-B
OUT-C: U16.20(OUTC) ; port OUT-C
OUT-D: U16.19(OUTD) ; port OUT-D
OUT-E: U16.18(OUTE) ; port OUT-E
OUT-F: U16.17(OUTF) ; port OUT-F
PG_PFC: J12.1 Q25.1(G) R83.1 ; port PG_PFC
SS/EN: C91.2 Q25.3(D) U16.5(SS/EN)
V_out: J13.1 R92.2 ; port V_out
VCC_FB: C89.2 C92.2 C99.2 C100.2 C101.2 D25.1(A) R83.2 R115.2 U16.23(VDD) U17.8(VDD+) U18.4(IN) ; port VCC_FB
VREF: C88.2 R86.1 R87.2 R88.2 R89.2 R104.1 U16.1(VREF)
NetC87_1: C87.1 C90.2 D22.1(K) U17.1(OUT1)
NetC87_2: C87.2 R84.2 R85.1 R90.1 R96.2 U17.2(IN1-)
NetC90_1: C90.1 R84.1
NetC93_2: C93.2 U16.3(EA–) U16.4(COMP)
NetC94_2: C94.2 R101.1 U16.15(CS)
NetC95_2: C95.2 R108.1 R109.2 U17.3(IN1+)
NetC96_1: C96.1 C97.1 D24.1(K) U17.7(OUT2)
NetC96_2: C96.2 R110.2 R111.1 U17.6(IN2-)
NetC97_2: C97.2 R110.1
NetC102_2: C102.2 R117.1 R120.2 U17.5(IN2+)
NetD23_3: D23.3(K) R101.2 R102.1
NetD25_2: D25.2(K) J15.4
NetR90_2: R90.2 R91.1
NetR91_2: R91.2 R92.1
NetR93_2: R93.2 U16.6(DELAB)
NetR94_2: R94.2 U16.7(DELCD)
NetR95_2: R95.2 U16.8(DELEF)
NetR97_2: R97.2 U16.9(TMIN)
NetR104_2: R104.2 U16.10(RT)
NetR105_2: R105.2 U16.11(RSUM)
NetR106_1: R106.1 R108.2
NetR106_2: R106.2 R107.1
NetR111_2: R111.2 R112.1 R113.1
NetR114_1: R114.1 R119.1 U19.2(REF)
NetR116_1: R116.1 R117.2
NetR116_2: R116.2 R118.1

Not connected (* = marked no-connect by the designer): J15 1* 3*; U16 16(SYNC)*; U18 1(FB/NC)* 3(NC)*

### Notes on the sheet
- Test Point
- (near U17) 0...2V => 0...32Vout
- (near R92) Voltage Loop
- FULL_BRIDGE_CONTROLLER
- 1.5V => 24V
- NOTE:
- Pull low on PG_PFC will turn ON the controller
- Current Loop
- Blue
- Black
- (near U17) 0...2V => 0...60A out
- Green
- Yellow
- Use with peripheral AUB0812VH-SP00 (DC FAN)
- FEED_BACK
- File:
- Title:
- Date:
- Page
- Num:
- Total:
- Drawn By: Huzaifa Ali